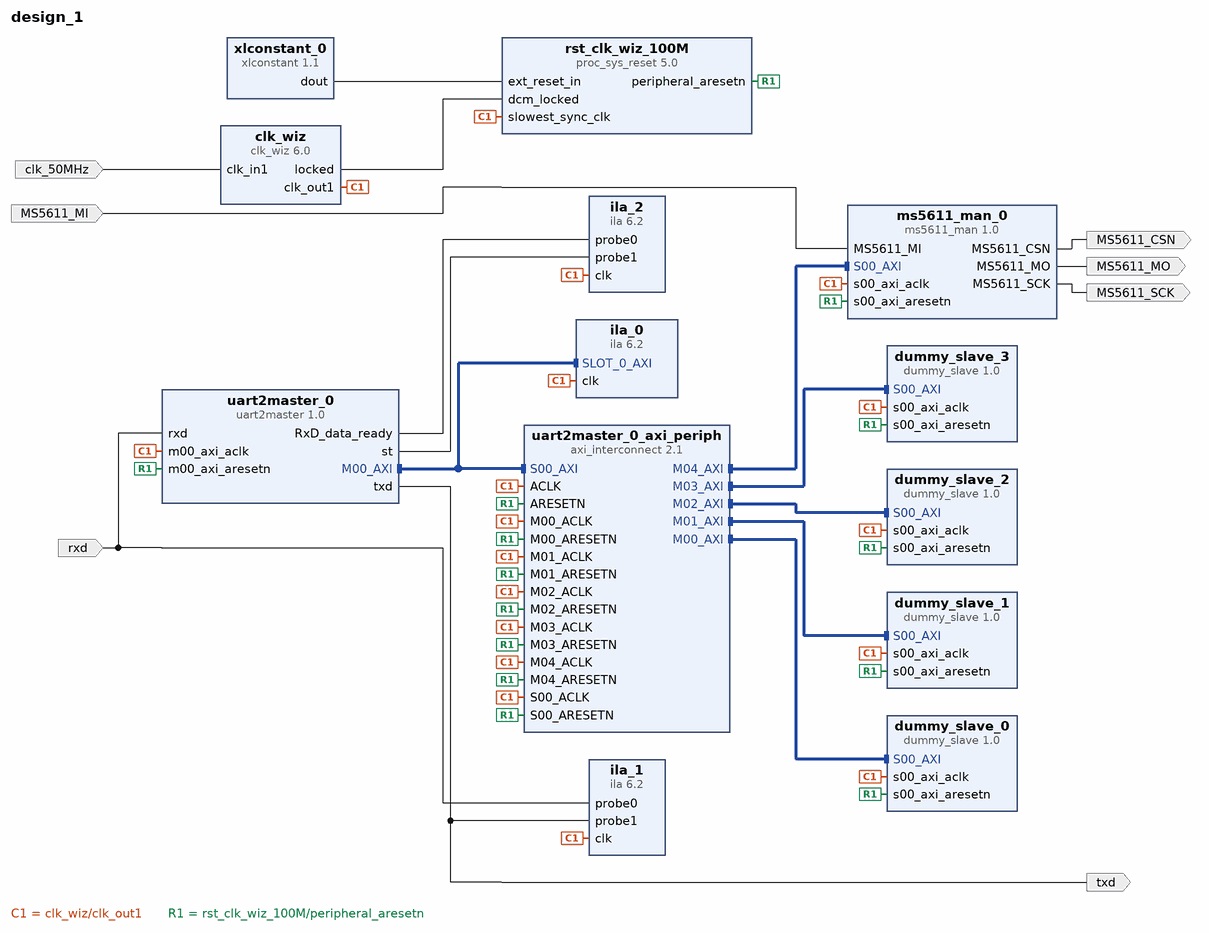
[diagram p0: block diagram of the top level]
# Vivado block design design_1, xcku5p-ffvb676-2-i, Vivado 2024.1
create_bd_design design_1

create_bd_port -dir O txd
create_bd_port -dir I rxd
create_bd_port -dir I -type clk clk_50MHz
set_property -dict {CONFIG.FREQ_HZ 50000000} [get_bd_ports clk_50MHz]
create_bd_port -dir O MS5611_CSN
create_bd_port -dir I MS5611_MI
create_bd_port -dir O MS5611_MO
create_bd_port -dir O MS5611_SCK

create_bd_cell -type ip -vlnv xilinx.com:user:uart2master:1.0 uart2master_0
create_bd_cell -type ip -vlnv xilinx.com:ip:axi_interconnect:2.1 uart2master_0_axi_periph
set_property -dict {CONFIG.NUM_MI 5} [get_bd_cells uart2master_0_axi_periph]
create_bd_cell -type ip -vlnv xilinx.com:ip:clk_wiz:6.0 clk_wiz
set_property -dict [list \
  CONFIG.CLKIN1_JITTER_PS 200.0 \
  CONFIG.CLKOUT1_JITTER 139.127 \
  CONFIG.CLKOUT1_PHASE_ERROR 154.678 \
  CONFIG.MMCM_CLKFBOUT_MULT_F 24.000 \
  CONFIG.MMCM_CLKIN1_PERIOD 20.000 \
  CONFIG.MMCM_CLKIN2_PERIOD 10.0 \
  CONFIG.PRIM_IN_FREQ 50.000 \
  CONFIG.USE_RESET false \
] [get_bd_cells clk_wiz]
create_bd_cell -type ip -vlnv xilinx.com:ip:proc_sys_reset:5.0 rst_clk_wiz_100M
create_bd_cell -type ip -vlnv xilinx.com:ip:xlconstant:1.1 xlconstant_0
set_property -dict {CONFIG.CONST_VAL 1} [get_bd_cells xlconstant_0]
create_bd_cell -type ip -vlnv xilinx.com:user:dummy_slave:1.0 dummy_slave_0
create_bd_cell -type ip -vlnv xilinx.com:user:dummy_slave:1.0 dummy_slave_1
create_bd_cell -type ip -vlnv xilinx.com:user:dummy_slave:1.0 dummy_slave_2
create_bd_cell -type ip -vlnv xilinx.com:user:dummy_slave:1.0 dummy_slave_3
create_bd_cell -type ip -vlnv xilinx.com:ip:ila:6.2 ila_0
create_bd_cell -type ip -vlnv xilinx.com:ip:ila:6.2 ila_1
set_property -dict {CONFIG.C_MONITOR_TYPE Native CONFIG.C_NUM_OF_PROBES 2} [get_bd_cells ila_1]
create_bd_cell -type ip -vlnv xilinx.com:ip:ila:6.2 ila_2
set_property -dict {CONFIG.C_MONITOR_TYPE Native CONFIG.C_NUM_OF_PROBES 2 CONFIG.C_PROBE1_WIDTH 8} [get_bd_cells ila_2]
create_bd_cell -type ip -vlnv xilinx.com:user:ms5611_man:1.0 ms5611_man_0

# ---- connections ----

connect_bd_intf_net [get_bd_intf_pins uart2master_0/M00_AXI] [get_bd_intf_pins uart2master_0_axi_periph/S00_AXI]
connect_bd_intf_net [get_bd_intf_pins uart2master_0/M00_AXI] [get_bd_intf_pins ila_0/SLOT_0_AXI]
connect_bd_intf_net [get_bd_intf_pins uart2master_0_axi_periph/M00_AXI] [get_bd_intf_pins dummy_slave_0/S00_AXI]
connect_bd_intf_net [get_bd_intf_pins uart2master_0_axi_periph/M01_AXI] [get_bd_intf_pins dummy_slave_1/S00_AXI]
connect_bd_intf_net [get_bd_intf_pins uart2master_0_axi_periph/M02_AXI] [get_bd_intf_pins dummy_slave_2/S00_AXI]
connect_bd_intf_net [get_bd_intf_pins uart2master_0_axi_periph/M03_AXI] [get_bd_intf_pins dummy_slave_3/S00_AXI]
connect_bd_intf_net [get_bd_intf_pins uart2master_0_axi_periph/M04_AXI] [get_bd_intf_pins ms5611_man_0/S00_AXI]
connect_bd_net -net MS5611_MI_0_1 [get_bd_ports MS5611_MI] [get_bd_pins ms5611_man_0/MS5611_MI]
connect_bd_net -net clk_100MHz_1 [get_bd_ports clk_50MHz] [get_bd_pins clk_wiz/clk_in1]
connect_bd_net [get_bd_pins clk_wiz/clk_out1] \
  [get_bd_pins uart2master_0_axi_periph/S00_ACLK] [get_bd_pins rst_clk_wiz_100M/slowest_sync_clk] \
  [get_bd_pins uart2master_0_axi_periph/M00_ACLK] [get_bd_pins uart2master_0_axi_periph/ACLK] \
  [get_bd_pins uart2master_0_axi_periph/M01_ACLK] [get_bd_pins dummy_slave_0/s00_axi_aclk] \
  [get_bd_pins dummy_slave_1/s00_axi_aclk] [get_bd_pins dummy_slave_2/s00_axi_aclk] \
  [get_bd_pins uart2master_0_axi_periph/M02_ACLK] [get_bd_pins dummy_slave_3/s00_axi_aclk] \
  [get_bd_pins uart2master_0_axi_periph/M03_ACLK] [get_bd_pins ila_0/clk] [get_bd_pins ila_1/clk] [get_bd_pins ila_2/clk] \
  [get_bd_pins uart2master_0/m00_axi_aclk] [get_bd_pins ms5611_man_0/s00_axi_aclk] \
  [get_bd_pins uart2master_0_axi_periph/M04_ACLK]
connect_bd_net [get_bd_pins clk_wiz/locked] [get_bd_pins rst_clk_wiz_100M/dcm_locked]
connect_bd_net [get_bd_pins ms5611_man_0/MS5611_CSN] [get_bd_ports MS5611_CSN]
connect_bd_net [get_bd_pins ms5611_man_0/MS5611_MO] [get_bd_ports MS5611_MO]
connect_bd_net [get_bd_pins ms5611_man_0/MS5611_SCK] [get_bd_ports MS5611_SCK]
connect_bd_net [get_bd_pins rst_clk_wiz_100M/peripheral_aresetn] \
  [get_bd_pins uart2master_0_axi_periph/S00_ARESETN] [get_bd_pins uart2master_0_axi_periph/M00_ARESETN] \
  [get_bd_pins uart2master_0_axi_periph/ARESETN] [get_bd_pins uart2master_0_axi_periph/M01_ARESETN] \
  [get_bd_pins dummy_slave_0/s00_axi_aresetn] [get_bd_pins dummy_slave_1/s00_axi_aresetn] \
  [get_bd_pins dummy_slave_2/s00_axi_aresetn] [get_bd_pins uart2master_0_axi_periph/M02_ARESETN] \
  [get_bd_pins dummy_slave_3/s00_axi_aresetn] [get_bd_pins uart2master_0_axi_periph/M03_ARESETN] \
  [get_bd_pins uart2master_0/m00_axi_aresetn] [get_bd_pins ms5611_man_0/s00_axi_aresetn] \
  [get_bd_pins uart2master_0_axi_periph/M04_ARESETN]
connect_bd_net -net rxd_0_1 [get_bd_ports rxd] [get_bd_pins ila_1/probe0] [get_bd_pins uart2master_0/rxd]
connect_bd_net [get_bd_pins uart2master_0/RxD_data_ready] [get_bd_pins ila_2/probe0]
connect_bd_net [get_bd_pins uart2master_0/st] [get_bd_pins ila_2/probe1]
connect_bd_net [get_bd_pins uart2master_0/txd] [get_bd_ports txd] [get_bd_pins ila_1/probe1]
connect_bd_net [get_bd_pins xlconstant_0/dout] [get_bd_pins rst_clk_wiz_100M/ext_reset_in]

# ---- address map ----
assign_bd_address -offset 0x44A00000 -range 64K -target_address_space [get_bd_addr_spaces uart2master_0/M00_AXI] [get_bd_addr_segs dummy_slave_0/S00_AXI/S00_AXI_reg]
assign_bd_address -offset 0x44A10000 -range 64K -target_address_space [get_bd_addr_spaces uart2master_0/M00_AXI] [get_bd_addr_segs dummy_slave_1/S00_AXI/S00_AXI_reg]
assign_bd_address -offset 0x44A20000 -range 64K -target_address_space [get_bd_addr_spaces uart2master_0/M00_AXI] [get_bd_addr_segs dummy_slave_2/S00_AXI/S00_AXI_reg]
assign_bd_address -offset 0x44A30000 -range 64K -target_address_space [get_bd_addr_spaces uart2master_0/M00_AXI] [get_bd_addr_segs dummy_slave_3/S00_AXI/S00_AXI_reg]
assign_bd_address -offset 0x44A40000 -range 64K -target_address_space [get_bd_addr_spaces uart2master_0/M00_AXI] [get_bd_addr_segs ms5611_man_0/S00_AXI/S00_AXI_reg]

validate_bd_design
save_bd_design
